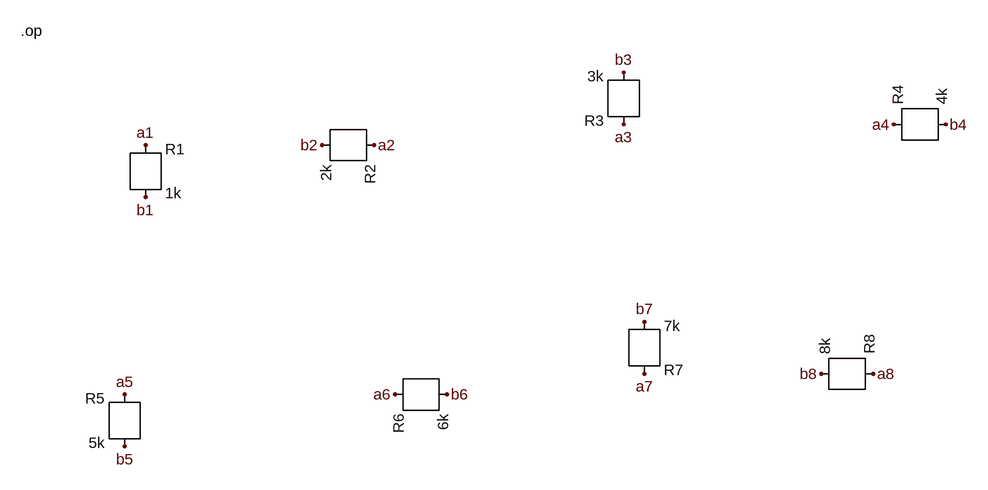
[diagram p0: schematic orient.asc]
orient.asc, the LTspice schematic file:
Version 4
SHEET 1 2000 1600
FLAG 208 208 a1
FLAG 208 288 b1
SYMBOL res 192 192 R0
SYMATTR InstName R1
SYMATTR Value 1k
FLAG 560 208 a2
FLAG 480 208 b2
SYMBOL res 576 192 R90
SYMATTR InstName R2
SYMATTR Value 2k
FLAG 944 176 a3
FLAG 944 96 b3
SYMBOL res 960 192 R180
SYMATTR InstName R3
SYMATTR Value 3k
FLAG 1360 176 a4
FLAG 1440 176 b4
SYMBOL res 1344 192 R270
SYMATTR InstName R4
SYMATTR Value 4k
FLAG 176 592 a5
FLAG 176 672 b5
SYMBOL res 192 576 M0
SYMATTR InstName R5
SYMATTR Value 5k
FLAG 592 592 a6
FLAG 672 592 b6
SYMBOL res 576 576 M90
SYMATTR InstName R6
SYMATTR Value 6k
FLAG 976 560 a7
FLAG 976 480 b7
SYMBOL res 960 576 M180
SYMATTR InstName R7
SYMATTR Value 7k
FLAG 1328 560 a8
FLAG 1248 560 b8
SYMBOL res 1344 576 M270
SYMATTR InstName R8
SYMATTR Value 8k
TEXT 16 32 Left 2 !.op

The netlist it stands for:
* orient.asc
R1 a1 b1 1k
R2 a2 b2 2k
R3 a3 b3 3k
R4 a4 b4 4k
R5 a5 b5 5k
R6 a6 b6 6k
R7 a7 b7 7k
R8 a8 b8 8k
.op
.backanno
.end